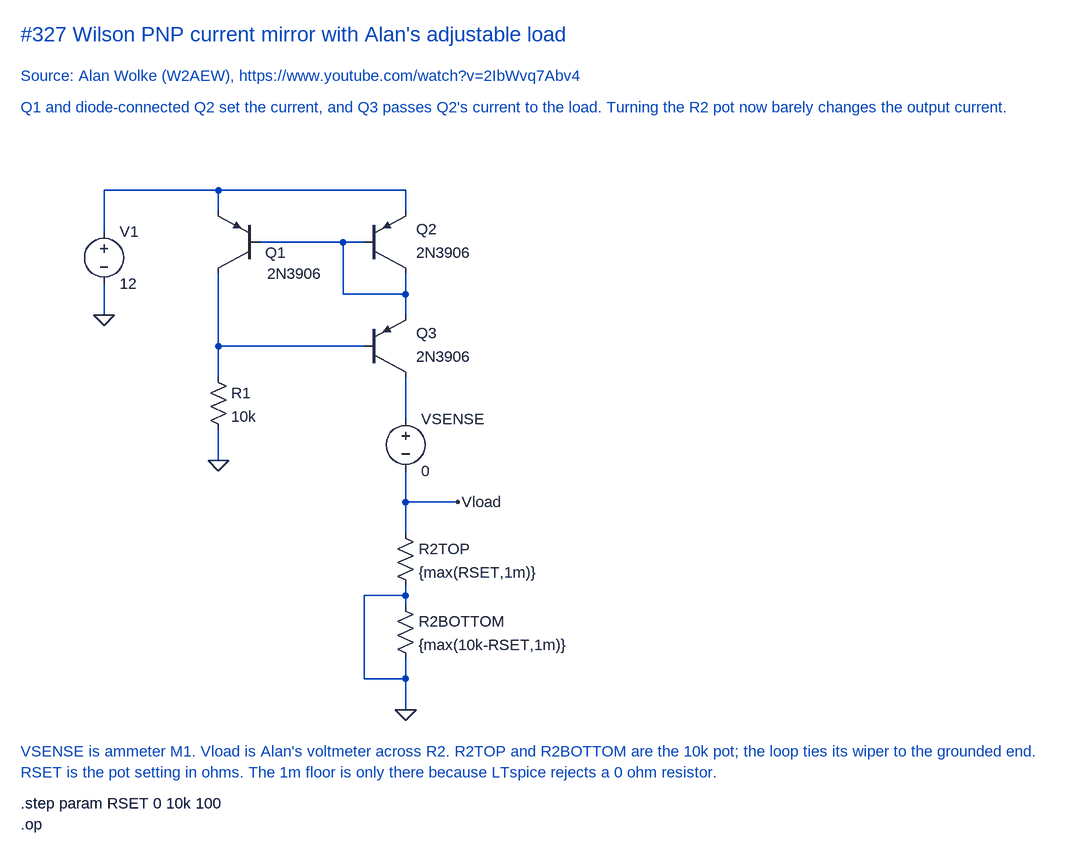
[diagram p0: schematic Wilson current mirror.asc]
Wilson current mirror.asc, the LTspice schematic file:
Version 4.1
SHEET 1 1708 1280
WIRE 336 272 160 272
WIRE 624 272 336 272
WIRE 336 304 336 272
WIRE 624 304 624 272
WIRE 160 336 160 272
WIRE 528 352 400 352
WIRE 560 352 528 352
WIRE 528 432 528 352
WIRE 624 432 624 400
WIRE 624 432 528 432
WIRE 160 464 160 416
WIRE 624 464 624 432
WIRE 336 512 336 400
WIRE 560 512 336 512
WIRE 336 560 336 512
WIRE 624 624 624 560
WIRE 336 688 336 640
WIRE 624 752 624 704
WIRE 704 752 624 752
WIRE 624 800 624 752
WIRE 624 896 624 880
WIRE 624 896 560 896
WIRE 624 912 624 896
WIRE 560 1024 560 896
WIRE 624 1024 624 992
WIRE 624 1024 560 1024
WIRE 624 1072 624 1024
FLAG 160 464 0
FLAG 336 688 0
FLAG 624 1072 0
FLAG 704 752 Vload
SYMBOL voltage 160 320 R0
SYMATTR InstName V1
SYMATTR Value 12
SYMBOL pnp 400 400 R180
WINDOW 0 -40 32 Left 2
WINDOW 3 -96 0 Left 2
SYMATTR InstName Q1
SYMATTR Value 2N3906
SYMBOL pnp 560 400 M180
WINDOW 0 80 68 Left 2
WINDOW 3 80 32 Left 2
SYMATTR InstName Q2
SYMATTR Value 2N3906
SYMBOL pnp 560 560 M180
WINDOW 0 80 68 Left 2
WINDOW 3 80 32 Left 2
SYMATTR InstName Q3
SYMATTR Value 2N3906
SYMBOL res 320 544 R0
SYMATTR InstName R1
SYMATTR Value 10k
SYMBOL voltage 624 608 R0
SYMATTR InstName VSENSE
SYMATTR Value 0
SYMBOL res 608 784 R0
SYMATTR InstName R2TOP
SYMATTR Value {max(RSET,1m)}
SYMBOL res 608 896 R0
SYMATTR InstName R2BOTTOM
SYMATTR Value {max(10k-RSET,1m)}
TEXT 32 32 Left 3 ;#327 Wilson PNP current mirror with Alan's adjustable load
TEXT 32 96 Left 2 ;Source: Alan Wolke (W2AEW), https://www.youtube.com/watch?v=2IbWvq7Abv4
TEXT 32 144 Left 2 ;Q1 and diode-connected Q2 set the current, and Q3 passes Q2's current to the load. Turning the R2 pot now barely changes the output current.
TEXT 32 1136 Left 2 ;VSENSE is ammeter M1. Vload is Alan's voltmeter across R2. R2TOP and R2BOTTOM are the 10k pot; the loop ties its wiper to the grounded end.
TEXT 32 1168 Left 2 ;RSET is the pot setting in ohms. The 1m floor is only there because LTspice rejects a 0 ohm resistor.
TEXT 32 1216 Left 2 !.step param RSET 0 10k 100
TEXT 32 1248 Left 2 !.op

The netlist it stands for:
* Wilson current mirror.asc
V1 N001 0 12
Q1 N003 N002 N001 0 2N3906
Q2 N002 N002 N001 0 2N3906
Q3 N004 N003 N002 0 2N3906
R1 N003 0 10k
VSENSE N004 Vload 0
R2TOP Vload 0 {max(RSET,1m)}
R2BOTTOM 0 0 {max(10k-RSET,1m)}
.model NPN NPN
.model PNP PNP
.lib standard.bjt
* #327 Wilson PNP current mirror with Alan's adjustable load
* Source: Alan Wolke (W2AEW), https://www.youtube.com/watch?v=2IbWvq7Abv4
* Q1 and diode-connected Q2 set the current, and Q3 passes Q2's current to the load. Turning the R2 pot now barely changes the output current.
* VSENSE is ammeter M1. Vload is Alan's voltmeter across R2. R2TOP and R2BOTTOM are the 10k pot; the loop ties its wiper to the grounded end.
* RSET is the pot setting in ohms. The 1m floor is only there because LTspice rejects a 0 ohm resistor.
.step param RSET 0 10k 100
.op
.backanno
.end